# EasyEDA Pro project ProProject_电子综合板子_2025-11-11.epro

# Schematic 核心板
Create Date: 2025-10-11; Page Name: P1; Project Name: 电子综合板子; Schematic Name: 核心板; Update Date: 2025-10-14; Company: 嘉立创EDA; Page Size: A4; Version: V1.0
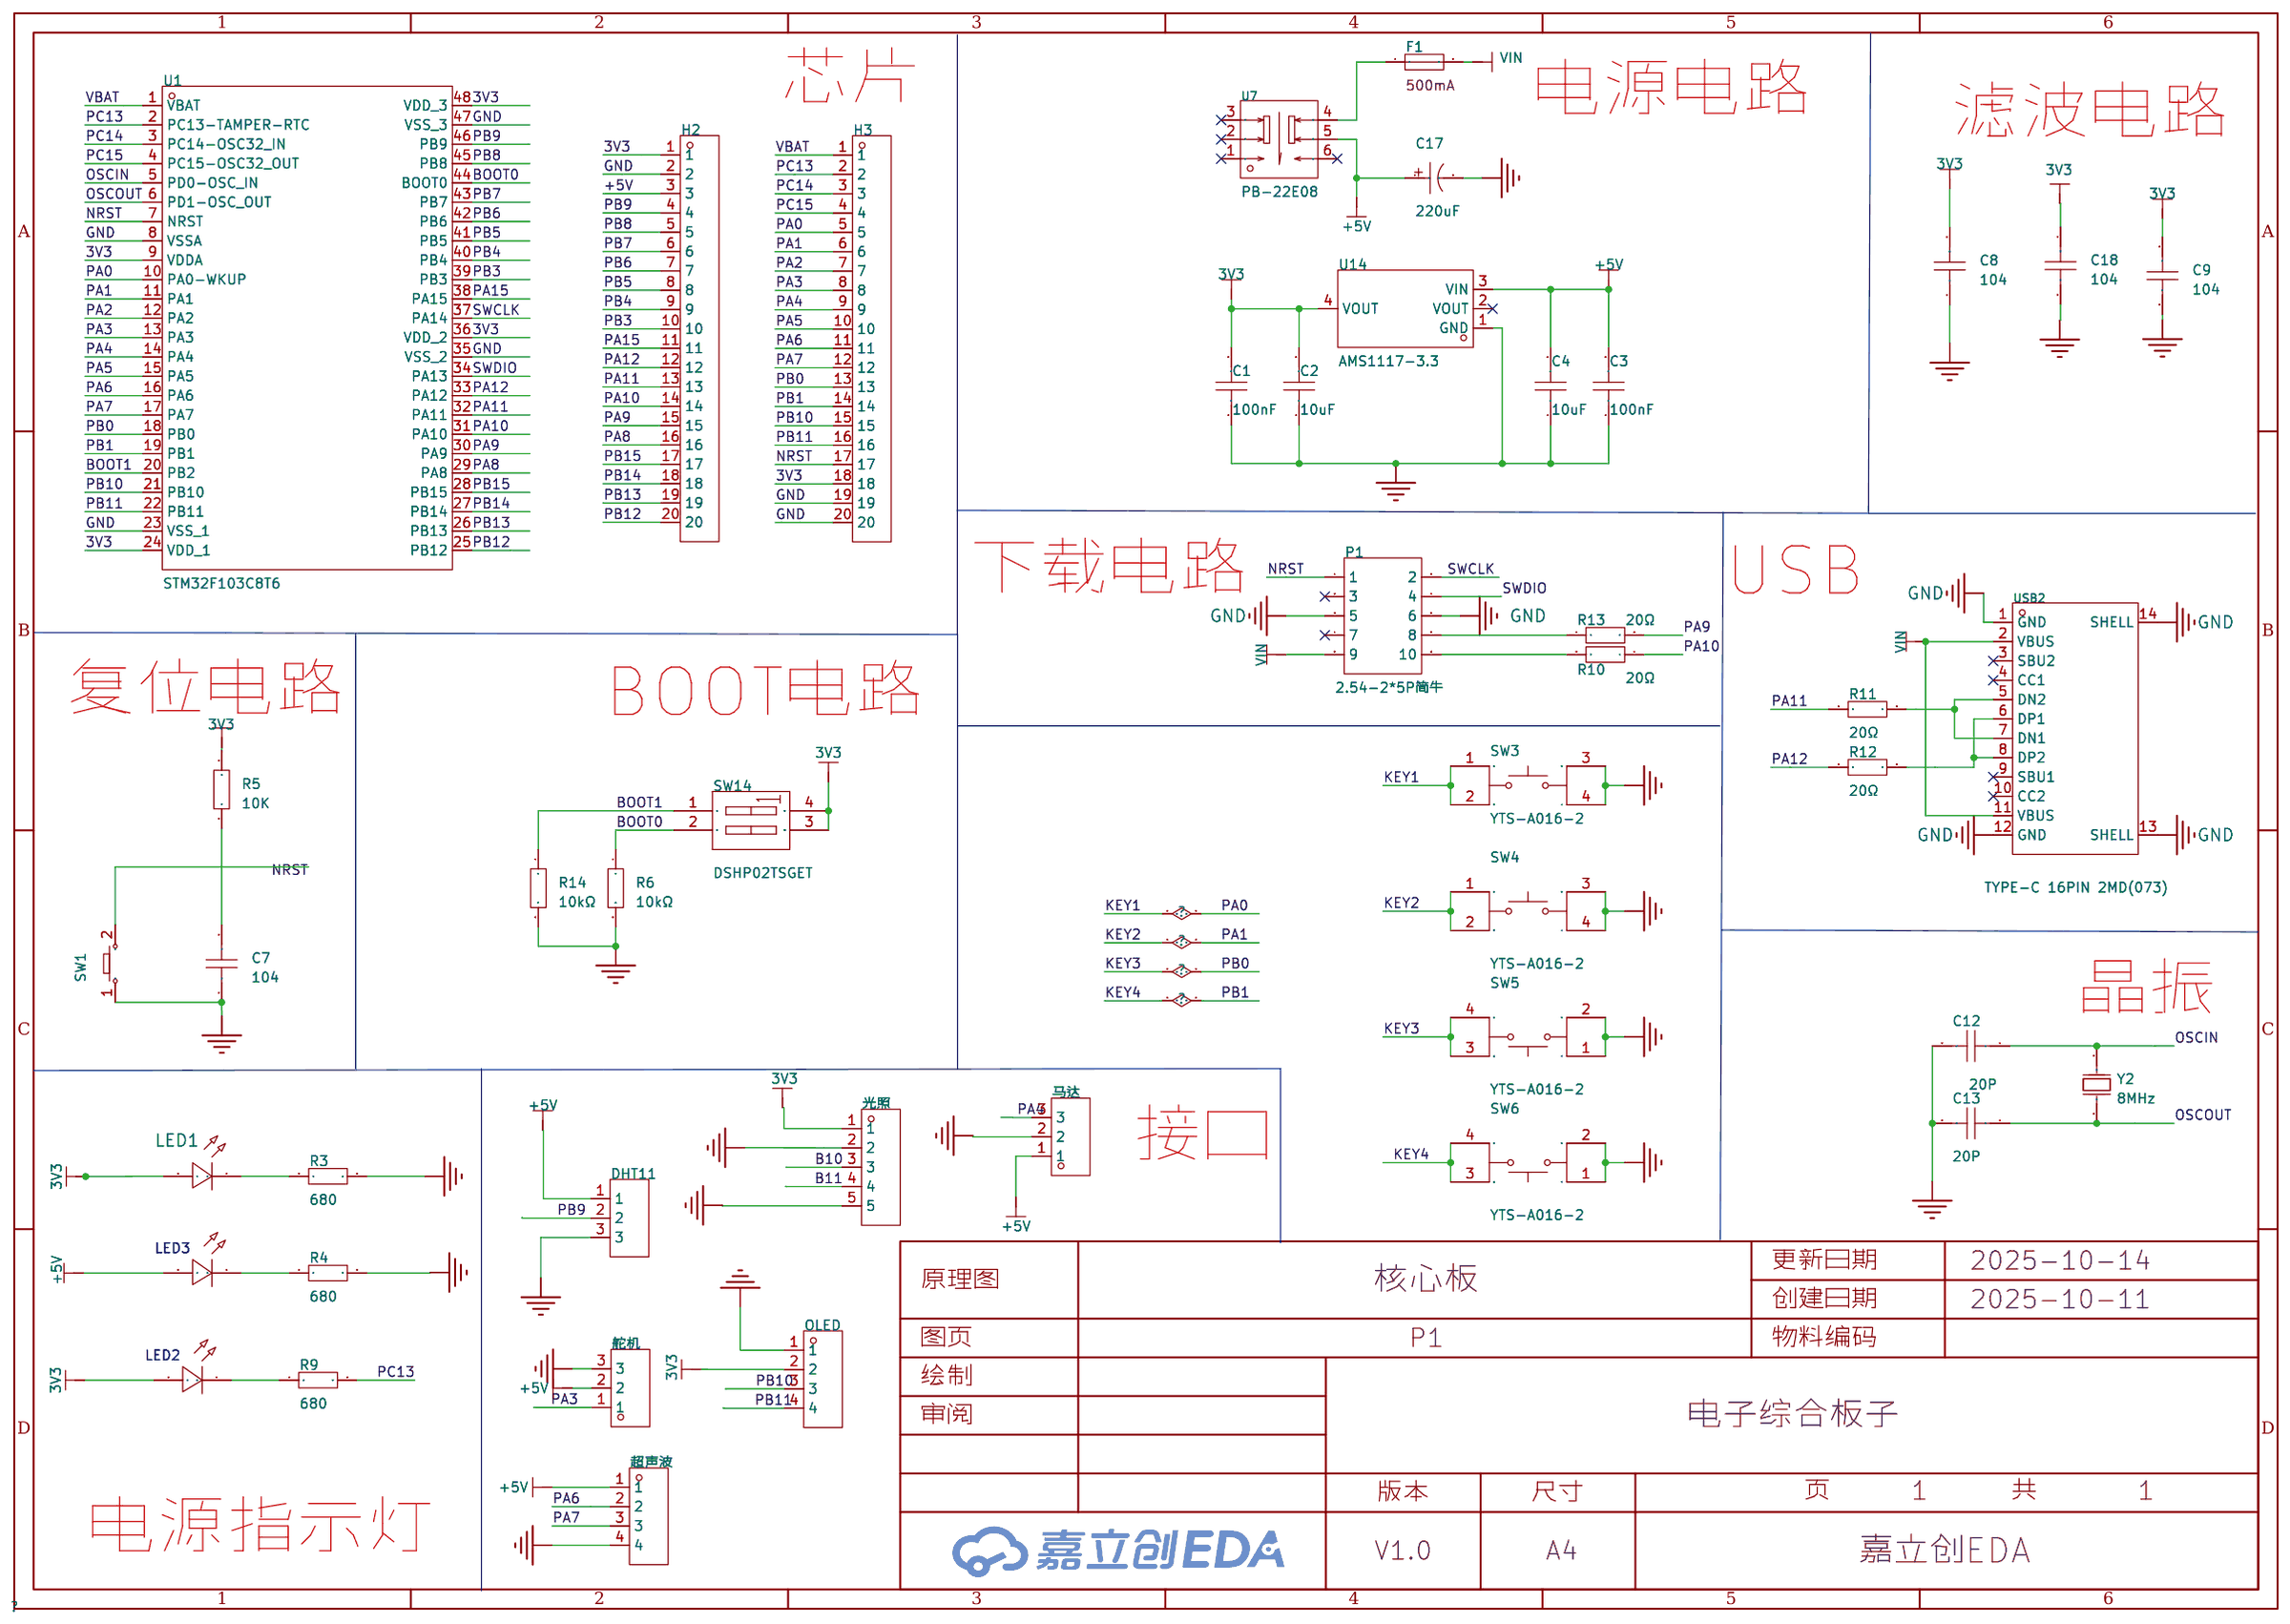
[diagram p0: schematic sheet]

## Parts
C1  100nF  [C0603]
C2  10uF  [C0603]
C3  100nF  [C0603]
C4  10uF  [C0603]
C7  104  [C0603]
C8  104  [C0603]
C9  104  [C0603]
C12  20P  [C0603]
C13  20P  [C0603]
C17  220uF  [CAP-SMD_BD6.3-L6.6-W6.6-LS7.2-R-RD]
C18  104  [C0603]
DHT11  PM254V-11-03-H85  [HDR-TH_3P-P2.54-V-F]
F1  BSMD0805-020-30V  [F0805]
H2  -  [HDR-TH_20P-P2.54-V-M-1]
H3  -  [HDR-TH_20P-P2.54-V-M-1]
LED1  -  [LED_0603]
LED2  -  [LED_0603]
LED3  -  [LED_0603]
OLED  PM254V-11-04-H85  [HDR-TH_4P-P2.54-V-F]
P1  2.54-2*5P简牛  [IDC-TH_10P-P2.54_C5665]
R3  680  [R0603]
R4  680  [R0603]
R5  10K  [R0603]
R6  10kΩ  [R0603]
R9  680  [R0603]
R10  20Ω  [R0603]
R11  20Ω  [R0603]
R12  20Ω  [R0603]
R13  20Ω  [R0603]
R14  10kΩ  [R0603]
SW1  -  [Key_SMD_3x4x2]
SW3  YTS-A016-2  [SW-SMD_4P-L4.2-W3.3-P2.15-LS4.7]
SW4  YTS-A016-2  [SW-SMD_4P-L4.2-W3.3-P2.15-LS4.7]
SW5  YTS-A016-2  [SW-SMD_4P-L4.2-W3.3-P2.15-LS4.7]
SW6  YTS-A016-2  [SW-SMD_4P-L4.2-W3.3-P2.15-LS4.7]
SW14  DSHP02TSGET  [SW-SMD_4P_DSHP02TSGET]
U1  STM32F103C8T6  [LQFP-48_L7.0-W7.0-P0.50-LS9.0-BL]
U7  PB-22E08  [SW-TH_6P-L8.0-W8.0-P2.50_PB-22E08]
U14  AMS1117-3.3  [SOT-223-3_L6.5-W3.4-P2.30-LS7.0-BR]
USB2  TYPE-C 16PIN 2MD(073)  [USB-C-SMD_TYPE-C-6PIN-2MD-073]
Y2  8MHz  [HC-49S_L11.4-W4.7-P4.88-D0.4]
光照  PM254V-11-05-H85  [HDR-TH_5P-P2.54-V-F]
舵机  -  [HDR-TH_3P-P2.54-V-M]
超声波  -  [HDR-TH_4P-P2.54-V-M]
马达  -  [HDR-TH_3P-P2.54-V-M]

## Library data of the parts
C1-C4 C7-C9 C12 C13 C18 = CAP_0603: Supplier Footprint: 0603
C17 = RVT1A221M0605: 容值:220uF;精度:±20%;额定电压:10V;纹波电流:-;等效串联电阻:-;; LCSC Part Name: 220uF ±20% 10V; Supplier Part: C3345; Manufacturer: HONOR(荣誉); Supplier Footprint: SMD,D6.3xL5.4mm; JLCPCB Part Class: 扩展库; Datasheet: https://atta.szlcsc.com/upload/public/pdf/source/20220520/1BCC52842751E84E020A4D0B70BC5F88.pdf; Supplier: LCSC; Tolerance: ±20%; Rated Voltage: 10V; φD: 6.3mm; L: 5.4mm; Lifetime @ Temp: 2000hrs@105℃; Operating Temperature: -55℃~+105℃
DHT11 = PM254V-11-03-H85: 插孔结构:1x3P;间距:2.54mm;行距:-;圆孔/方孔:方孔;安装方式:直插;排数:单排;总孔位数:3P;额定电流:3A;插孔方向:顶部;塑高:8.5mm;触头材质:黄铜;触头镀层:-;工作温度:-40℃~+105℃;; LCSC Part Name: 1x3P 间距:2.54mm 直插; Supplier Part: C541850; Manufacturer: XFCN(兴飞); Supplier Footprint: 插件,P=2.54mm; JLCPCB Part Class: 扩展库; Datasheet: https://item.szlcsc.com/datasheet/PM254V-11-03-H85/562471.html; Supplier: LCSC; Holes Structure: 1x3P; Pitch: 2.54mm; Circular Hole / Square Hole: 方孔; Mounting Type: 直插; Number of Rows: 单排; Number of Positions: 3P; Current Rating: 3A; Holes Direction: 顶部; Insulation Height: 8.5mm; Contact Material: 黄铜; Operating Temperature: -40℃~+105℃
F1 = BSMD0805-020-30V: 最大电压:30V;最大电流:40A;保持电流:200mA;跳闸电流:500mA;; LCSC Part Name: 30V 200mA 0805自恢复; Supplier Part: C883105; Manufacturer: BHFUSE(佰宏); Supplier Footprint: 0805; JLCPCB Part Class: 扩展库; Datasheet: https://atta.szlcsc.com/upload/public/pdf/source/20220223/3FD8E8A8A3681642EAEF465E16495357.pdf; Supplier: LCSC; Operating Voltage (Max): 30V; Current Rating (Max): 40A; Hold Current: 200mA; Trip Current: 500mA; Power Dissipation: 500mW; Resistance - Initial (Ri) (Min): 500mΩ; Resistance - Post Trip (R1) (Max): 3.5Ω; Maximum Time to Trip: 20ms; Operating Temperature: -40℃~+85℃
H2 H3 = HDR-M_2.54_1x20P: Supplier Part: C50981; Supplier Footprint: 插件
LED1 = LED_0603-R: Supplier Footprint: 0603
LED2 LED3 = LED_0603-B: Supplier Footprint: 0603
OLED = PM254V-11-04-H85: 插孔结构:1x4P;间距:2.54mm;行距:-;圆孔/方孔:方孔;安装方式:直插;排数:单排;总孔位数:4P;额定电流:3A;插孔方向:顶部;塑高:8.5mm;触头材质:黄铜;触头镀层:-;工作温度:-40℃~+105℃;; LCSC Part Name: 1x4P 间距:2.54mm 直插; Supplier Part: C541851; Manufacturer: XFCN(兴飞); Supplier Footprint: 插件,P=2.54mm; JLCPCB Part Class: 扩展库; Datasheet: https://item.szlcsc.com/datasheet/PM254V-11-04-H85/562472.html; Supplier: LCSC; Holes Structure: 1x4P; Pitch: 2.54mm; Circular Hole / Square Hole: 方孔; Mounting Type: 直插; Number of Rows: 单排; Number of Positions: 4P; Current Rating: 3A; Holes Direction: 顶部; Insulation Height: 8.5mm; Contact Material: 黄铜; Operating Temperature: -40℃~+105℃
P1 = 2.54-2*5P简牛: 连接器类型:简牛座;每排PIN数:5;排数:2;间距:2.54mm;行距:2.54mm;封装形式:直插;触头材质:-;触头镀层:-;; LCSC Part Name: 每排P数:5 排数:2 2.54mm; Supplier Part: C5665; Manufacturer: BOOMELE(博穆精密); Supplier Footprint: 插件,P=2.54mm; JLCPCB Part Class: 扩展库; Datasheet: https://atta.szlcsc.com/upload/public/pdf/source/20140331/1457707037896.pdf; Supplier: LCSC; Connector Type: 简牛座; Pin Number in each Row: 5; Number of Rows: 2; Pitch: 2.54mm; Row Spacing: 2.54mm; Holder Type: 直插
R3-R5 R9 = Res_0603: Supplier Footprint: 0603
R6 R14 = RC0603JR-0710KL: 电阻类型:厚膜电阻;阻值:10kΩ;精度:±5%;功率:100mW;; LCSC Part Name: 10kΩ ±5% 100mW; Supplier Part: C99198; Manufacturer: YAGEO(国巨); Supplier Footprint: 0603; JLCPCB Part Class: 扩展库; Datasheet: https://atta.szlcsc.com/upload/public/pdf/source/20181223/C99198_917934A193F41F77D9F7D214A8C79116.pdf; Supplier: LCSC; Type: 厚膜电阻; Tolerance: ±5%; Power(Watts): 100mW; Temperature Coefficient: ±100ppm/℃; Overload Voltage (Max): 75V; Operating Temperature Range: -55℃~+155℃
R10-R13 = 0603WAF200JT5E: 电阻类型:厚膜电阻;阻值:20Ω;精度:±1%;功率:100mW;; LCSC Part Name: 20Ω ±1% 100mW; Supplier Part: C22950; Manufacturer: UNI-ROYAL(厚声); Supplier Footprint: 0603; JLCPCB Part Class: Basic Part; Datasheet: https://atta.szlcsc.com/upload/public/pdf/source/20200306/C422600_1E6D84923E4A46A82E41ADD87F860B5C.pdf; Supplier: LCSC; Type: 厚膜电阻; Tolerance: ±1%; Power(Watts): 100mW; Temperature Coefficient: ±100ppm/℃; Overload Voltage (Max): 75V; Operating Temperature Range: -55℃~+155℃
SW1 = Key_SMD_3x4x2: Supplier Footprint: SMD
SW3-SW6 = YTS-A016-2: 电路结构:单刀单掷;按钮形状:椭圆形按钮;作用力:2.6N;安装方式:立贴;开关长度:4.2mm;开关宽度:3.4mm;开关高度:2.5mm;带支架:不带;触点电流:50mA;额定电压(DC):12V;绝缘电阻:100MΩ;机械寿命:10万次;; LCSC Part Name: 4.2*3.4*2.5mm 立贴 轻触开关; Supplier Part: C2910673; Manufacturer: YIYUAN(怡远); Supplier Footprint: SMD; JLCPCB Part Class: 扩展库; Datasheet: https://atta.szlcsc.com/upload/public/pdf/source/20211104/F07B7201482F381EAEC9C23BE16B5334.pdf; Supplier: LCSC; Circuit: 单刀单掷; Actuator Style: 椭圆形按钮; Operating Force: 2.6N; Mounting Style: 立贴; Switch Length: 4.2mm; Switch Width: 3.4mm; Switch Height: 2.5mm; Strike Gundam: 不带; Contact Current: 50mA; Voltage Rating (DC): 12V; Insulation Resistance: 100MΩ; Actuator/Cap Color: 白色; Pin Style: J型引脚; Mechanical Life: 10万次
SW14 = DSHP02TSGET: 类型:平拨，凹槽式;电路结构:单刀单掷;开关位数:2;引脚间距:1.27mm;颜色:黑色;; LCSC Part Name: 2位 1.27间距; Supplier Part: C40735; Manufacturer: YE; Supplier Footprint: SMD-4P,4.1x5.4mm; JLCPCB Part Class: 扩展库; Datasheet: https://atta.szlcsc.com/upload/public/pdf/source/20150928/1457707425261.pdf; Supplier: LCSC; Type: 平拨，凹槽式; Circuit: 单刀单掷; Number of Positions: 2; Lead Pitch: 1.27mm; Color: 黑色
U1 = STM32F103C8T6: LCSC Part Name: 主流增强型ARM Cortex-M3 MCU，具有64 KB Flash、72 MHz CPU、电机控制、USB和CAN; Supplier Part: C8734; Manufacturer: ST(意法半导体); Supplier Footprint: LQFP-48(7x7); JLCPCB Part Class: 扩展库; Datasheet: https://atta.szlcsc.com/upload/public/pdf/source/20220812/8363ACEC51AD55ECEB84799464F7CB85.pdf; Supplier: LCSC; CPU Core: ARM-M3; Program Storage Size: 64KB; RAM Size: 20KB; GPIO Ports Number: 37; Operating Voltage Range: 2V~3.6V; CPU Maximum Speed: 72MHz; Program Memory Type: FLASH; Operating Temperature Range: -40℃~+85℃; ADC (Bit): 12bit; Universal Serial Bus: 有; Peripheral/Function: 看门狗；DMA；看门狗；温度传感器; Watchdog: 有; Infrared Data Association: 有; Low-Voltage Detect: 有; Direct Memory Access: 有; Internal Oscillator: 有
U7 = PB-22E08: LCSC Part Name: 自锁按键开关; Supplier Part: C2848958; Manufacturer: G-Switch(品赞); Supplier Footprint: 8x8mm; Datasheet: https://atta.szlcsc.com/upload/public/pdf/source/20230616/E4440AC7CE198A071B7CAB3CD31ABBEA.pdf; Supplier: LCSC
U14 = AMS1117-3.3_C6186: 输出类型:固定;最大输入电压:-;输出电压:3.3V;最大输出电流:1A;电源纹波抑制比(PSRR):72dB@(120Hz);输出极性:正极;; LCSC Part Name: 输出3.3V 1A; Supplier Part: C6186; Manufacturer: AMS; Supplier Footprint: SOT-223-3; JLCPCB Part Class: 基础库; Datasheet: https://atta.szlcsc.com/upload/public/pdf/source/20180727/C6186_7A095716F0823C02F1997A905E26C086.pdf; Supplier: LCSC; Output Type: 固定; Output Voltage: 3.3V; MAX Output Current: 1A; Power Supply Rejection Ratio (PSRR): 72dB@(120Hz); Dropout Voltage: 1.3V@(800mA); Output Polarity: 正极; Number of Outputs: 1
USB2 = TYPE-C 16PIN 2MD(073): 连接器类型:Type-C;标准:-;公母:母座;触点数量:16;端口数量:1;安装方式:卧贴;额定电流 - 电源:5A;工作温度范围:-25℃~+85℃;; LCSC Part Name: TYPE-C母座 16P 4脚插件带定位柱 不锈钢外壳 2次模顶; Supplier Part: C2765186; Manufacturer: SHOU HAN(首韩); Supplier Footprint: SMD; JLCPCB Part Class: 扩展库; Datasheet: https://item.szlcsc.com/datasheet/TYPE-C%252016PIN%25202MD(073)/2901843.html; Supplier: LCSC; Connector Type: Type-C; Gender: 母座; Mounting Type: 卧贴; Number of Contacts: 16; Number of Ports: 1; Current Rating-Power: 3A; Voltage Rating: 5V; Connect-Disconnect Life: 5千次; Detection color: 黑色; Operating Temperature: -25℃~+85℃; Mounting Style: 卧贴; Current Rating - Power (Max): 5A; Operating Temperature Range: -25℃~+85℃
Y2 = ECS-080-20-4X-DU: LCSC Part Name: 8MHz ±30ppm 20pF; Supplier Part: C2636160; Manufacturer: ECS; Supplier Footprint: HC-49S; JLCPCB Part Class: 扩展库; Datasheet: https://atta.szlcsc.com/upload/public/pdf/source/20181031/C312311_8C746D9B0903A43D812CE762944D4B2E.pdf; Supplier: LCSC; Normal temperature Frequency Tolerance: ±30ppm; External load capacitor: 20pF; Frequency Stability(Full temperature range): ±100ppm; Equivalent Series Resistance (ESR): 80Ω; Operating Temperature: -55℃~+125℃
光照 = PM254V-11-05-H85: 插孔结构:1x5P;间距:2.54mm;行距:-;圆孔/方孔:方孔;安装方式:直插;排数:单排;总孔位数:5P;额定电流:3A;插孔方向:顶部;塑高:8.5mm;触头材质:黄铜;触头镀层:-;工作温度:-40℃~+105℃;; LCSC Part Name: 1x5P 间距:2.54mm 直插; Supplier Part: C541852; Manufacturer: XFCN(兴飞); Supplier Footprint: 插件,P=2.54mm; JLCPCB Part Class: 扩展库; Datasheet: https://item.szlcsc.com/datasheet/PM254V-11-05-H85/562473.html; Supplier: LCSC; Holes Structure: 1x5P; Pitch: 2.54mm; Circular Hole / Square Hole: 方孔; Mounting Type: 直插; Number of Rows: 单排; Number of Positions: 5P; Current Rating: 3A; Holes Direction: 顶部; Insulation Height: 8.5mm; Contact Material: 黄铜; Operating Temperature: -40℃~+105℃
舵机 马达 = HDR-M_2.54_1x3P: Supplier Part: C2937625; Supplier Footprint: 插件
超声波 = HDR-M_2.54_1x4P: Supplier Part: C492403; Supplier Footprint: 插件

## Nets
3V3: C1.2 C2.2 C18.1 H2.1 H3.18 LED2.2(A) OLED.2 SW14.3(B2) SW14.4(B1) U1.9(VDDA) U1.24(VDD_1) U14.4(VOUT)
+5V: C3.2 C4.2 H2.3 U14.3(VIN) 舵机.2
GND: C1.1 C2.1 C3.1 C4.1 C7.1 C18.2 H2.2 H3.19 H3.20 OLED.1 R6.2 R14.2 SW3.3 SW3.4 SW4.3 SW4.4 SW5.1 SW5.2 SW6.1 SW6.2 U1.8(VSSA) U1.23(VSS_1) U14.1(GND) USB2.1(GND) USB2.12(GND) USB2.13(SHELL) USB2.14(SHELL) 舵机.3
VBAT: H3.1 U1.1(VBAT)
VIN: USB2.2(VBUS) USB2.11(VBUS)
BOOT0: R6.1 SW14.2(A2)
BOOT1: R14.1 SW14.1(A1) U1.20(PB2)
KEY1: H3.5 SW3.1 SW3.2 U1.10(PA0-WKUP)
KEY2: H3.6 SW4.1 SW4.2 U1.11(PA1)
KEY3: H3.13 SW5.3 SW5.4 U1.18(PB0)
KEY4: H3.14 SW6.3 SW6.4 U1.19(PB1)
NRST: H3.17 U1.7(NRST)
OSCIN: U1.5(PD0-OSC_IN) Y2.2
OSCOUT: U1.6(PD1-OSC_OUT) Y2.1
PA2: H3.7 U1.12(PA2)
PA3: H3.8 U1.13(PA3) 舵机.1
PA4: H3.9 U1.14(PA4)
PA5: H3.10 U1.15(PA5)
PA6: H3.11 U1.16(PA6)
PA7: H3.12 U1.17(PA7)
PA8: H2.16
PA9: H2.15
PA10: H2.14
PA11: H2.13 R11.1
PA12: H2.12 R12.1
PA15: H2.11
PB3: H2.10
PB4: H2.9
PB5: H2.8
PB6: H2.7
PB7: H2.6
PB8: H2.5
PB9: H2.4
PB10: H3.15 OLED.3 U1.21(PB10)
PB11: H3.16 OLED.4 U1.22(PB11)
PB12: H2.20
PB13: H2.19
PB14: H2.18
PB15: H2.17
PC13: H3.2 R9.2 U1.2(PC13-TAMPER-RTC)
PC14: H3.3 U1.3(PC14-OSC32_IN)
PC15: H3.4 U1.4(PC15-OSC32_OUT)
$1N1999: LED2.1(C) R9.1
Net-(USB2-5): USB2.5(DN2) USB2.7(DN1)
Net-(USB2-6): USB2.6(DP1) USB2.8(DP2)

Not connected (* = marked no-connect by the designer): C7 2; C8 1 2; C9 1 2; C12 1 2; C13 1 2; C17 1 2; DHT11 1 2 3; F1 1 2; LED1 1(C) 2(A); LED3 1(C) 2(A); P1 1 2 3* 4 5 6 7* 8 9 10; R3 1 2; R4 1 2; R5 1 2; R10 1 2; R11 2; R12 2; R13 1 2; SW1 1 2; U1 25(PB12) 26(PB13) 27(PB14) 28(PB15) 29(PA8) 30(PA9) 31(PA10) 32(PA11) 33(PA12) 34(PA13) 35(VSS_2) 36(VDD_2) 37(PA14) 38(PA15) 39(PB3) 40(PB4) 41(PB5) 42(PB6) 43(PB7) 44(BOOT0) 45(PB8) 46(PB9) 47(VSS_3) 48(VDD_3); U7 1* 2* 3* 4 5 6*; U14 2(VOUT)*; USB2 3(SBU2)* 4(CC1)* 9(SBU1)* 10(CC2)*; 光照 1 2 3 4 5; 超声波 1 2 3 4; 马达 1 2 3

## Notes on the sheet
- 芯片
- 电源电路
- 滤波电路
- 下载电路
- USB
- 复位电路
- BOOT电路
- 晶振
- 接口
- 电源指示灯

# Board PCB1
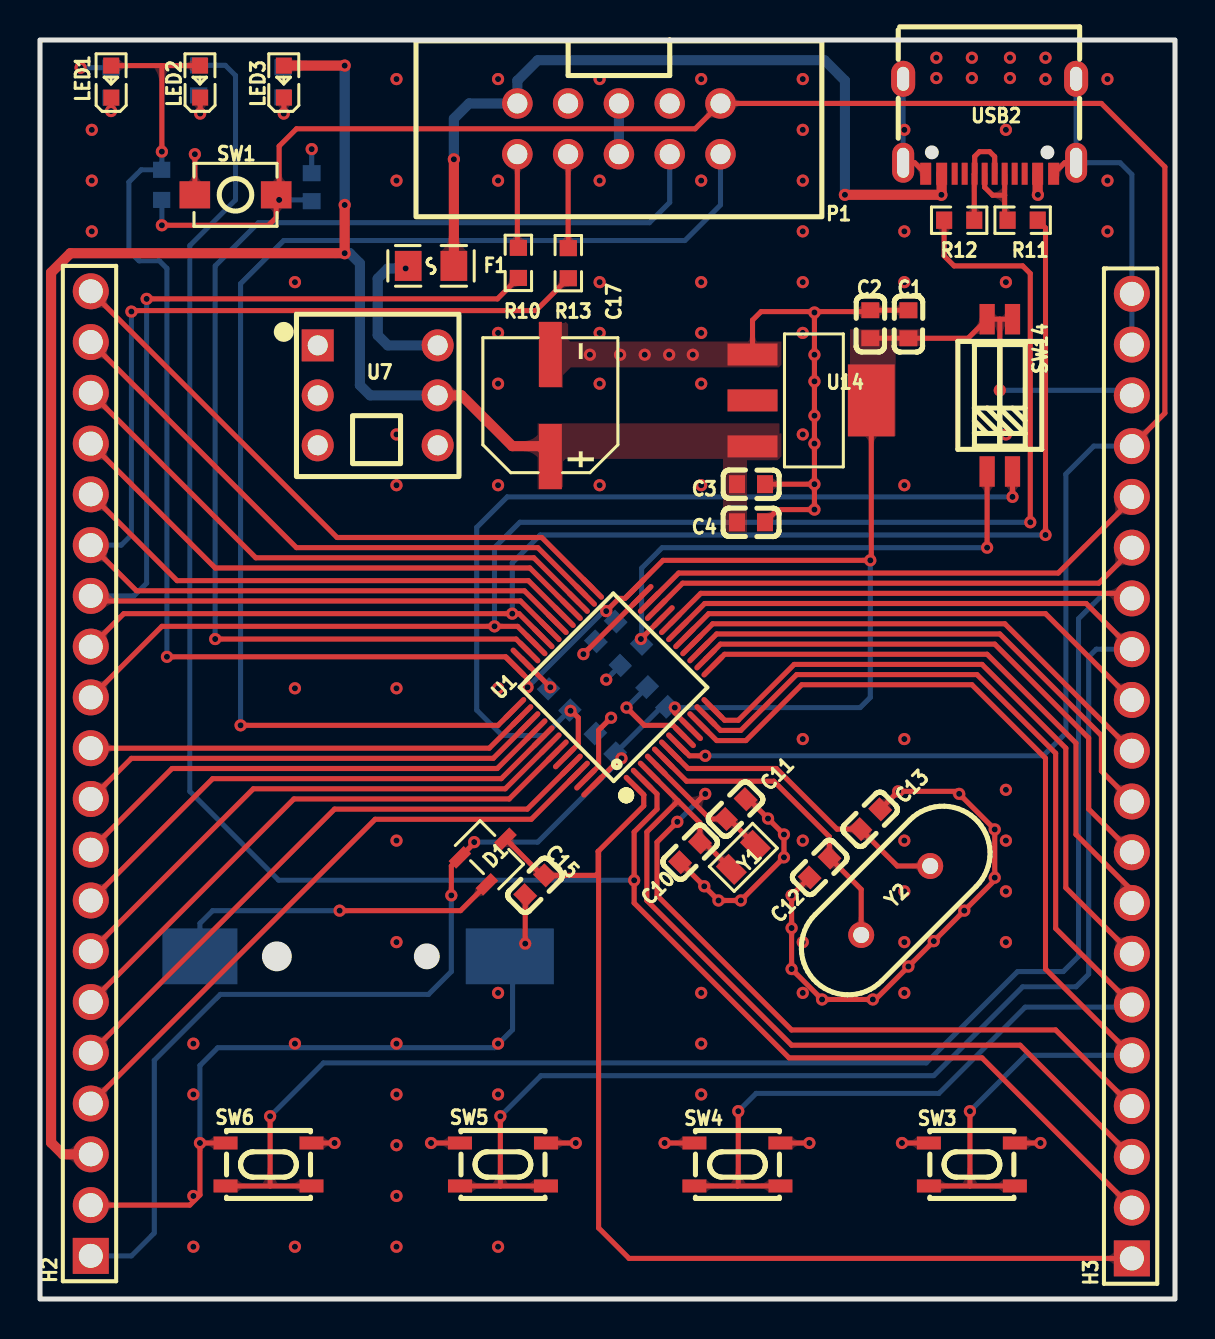
[diagram p1: board, top side]
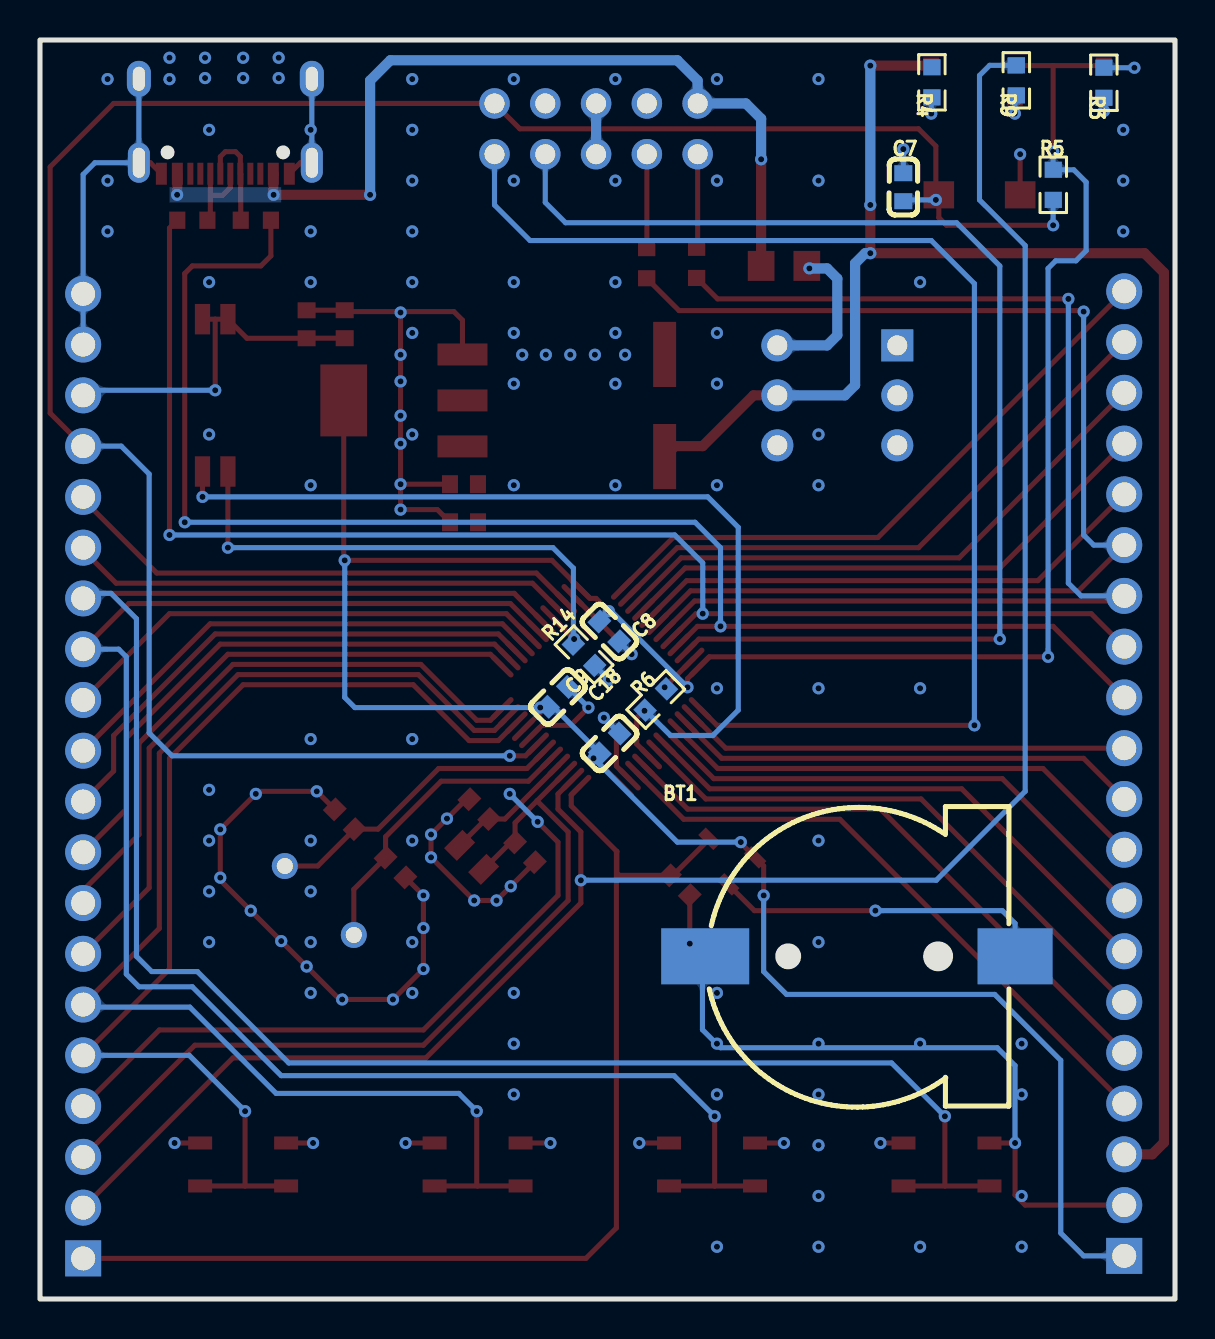
[diagram p2: board, bottom side, seen from below]

Outline 56.77 x 62.99 mm; copper layers: Top Layer, Inner1, Inner2, Inner3, Inner4, Inner5, Inner6, Inner7, Inner8, Inner9, Inner10, Inner11, Inner12, Inner13, Inner14, Inner15, Inner16, Inner17, Inner18, Inner19, Inner20, Inner21, Inner22, Inner23, Inner24, Inner25, Inner26, Inner27, Inner28, Inner29, Inner30, Bottom Layer. Coordinates in mm from the lower left corner of the outline.
Outline path: rectangle 0,62.99 56.77,0
Stack: Top Layer 0.035mm / Dielectric1 1.51mm FR4 er 4.5 / Bottom Layer 0.035mm

## Design rules (mm)
template: JLCPCB Capability(Two Layers Board)
spacing copperThickness1oz (default): track to track 0.102, other pairs 0.152 to 0.3
spacing copperThickness2oz: track to track 0.203, other pairs 0.152 to 0.3
track width copperThickness1oz (default): min 0.127, default 0.254, max 2.54
track width copperThickness2oz: min 0.203, default 0.254, max 2.54
differential pair differentialPair (default): width min 0.127, default 0.254, max 2.54; gap min 0.152, default 0.152
via viaSize (default): diameter min 0.5, default 0.61, max 10; hole min 0.3, default 0.305, max 6.3

## Placement (name value [footprint] x y rotation side)
BT1  BS-12-B3AA003  [BAT-SMD_BS-12-B3AA011]  15.75 17.14 180 bottom
C1  100nF  [C0603]  43.43 48.77 270 top
C2  10uF  [C0603]  41.53 48.77 270 top
C3  100nF  [C0603]  35.56 40.77 180 top
C4  10uF  [C0603]  35.56 38.86 180 top
C7  104  [C0603]  13.59 55.63 270 bottom
C8  104  [C0603]  28.3 33.4 45 bottom
C9  104  [C0603]  30.86 30.12 135 bottom
C10  20P  [C0603]  32.51 22.35 225 top
C11  20P  [C0603]  34.8 24.51 45 top
C12  20P  [C0603]  38.99 21.59 225 top
C13  20P  [C0603]  41.53 24 45 top
C15  100nF  [C0603]  24.77 20.7 45 top
C17  220uF  [CAP-SMD_BD6.3-L6.6-W6.6-LS7.2-R-RD]  25.53 44.7 270 top
C18  104  [C0603]  28.27 27.8 135 bottom
D1  BAT54C  [SOT-23-3_L2.9-W1.4-P1.91-LS2.6-BR]  22.48 22.22 225 top
F1  BSMD0805-020-30V  [F0805]  19.56 51.69 0 top
H2  -  [HDR-TH_20P-P2.54-V-M-1]  2.54 26.29 90 top
H3  -  [HDR-TH_20P-P2.54-V-M-1]  54.61 26.16 90 top
LED1  -  [LED_0603]  3.56 60.96 90 top
LED2  -  [LED_0603]  8 60.96 90 top
LED3  -  [LED_0603]  12.19 60.96 90 top
P1  2.54-2*5P简牛  [IDC-TH_10P-P2.54_C5665]  28.96 58.55 180 top
R3  680  [R0603]  3.56 60.85 90 bottom
R4  680  [R0603]  12.16 60.87 90 bottom
R5  10K  [R0603]  6.09 55.74 90 bottom
R6  10kΩ  [R0603]  25.97 30 135 bottom
R9  680  [R0603]  7.94 60.97 90 bottom
R10  20Ω  [R0603]  23.93 51.84 90 top
R11  20Ω  [R0603]  49.15 53.97 180 top
R12  20Ω  [R0603]  45.97 53.97 0 top
R13  20Ω  [R0603]  26.42 51.82 270 top
R14  10kΩ  [R0603]  29.56 32.23 225 bottom
SW1  -  [Key_SMD_3x4x2]  9.78 55.25 0 top
SW3  YTS-A016-2  [SW-SMD_4P-L4.2-W3.3-P2.15-LS4.7]  46.61 6.73 180 top
SW4  YTS-A016-2  [SW-SMD_4P-L4.2-W3.3-P2.15-LS4.7]  34.88 6.73 180 top
SW5  YTS-A016-2  [SW-SMD_4P-L4.2-W3.3-P2.15-LS4.7]  23.16 6.73 0 top
SW6  YTS-A016-2  [SW-SMD_4P-L4.2-W3.3-P2.15-LS4.7]  11.43 6.73 0 top
SW14  DSHP02TSGET  [SW-SMD_4P_DSHP02TSGET]  48.01 45.21 0 top
U1  STM32F103C8T6  [LQFP-48_L7.0-W7.0-P0.50-LS9.0-BL]  28.7 30.61 45 top
U7  PB-22E08  [SW-TH_6P-L8.0-W8.0-P2.50_PB-22E08]  16.89 45.21 270 top
U14  AMS1117-3.3  [SOT-223-3_L6.5-W3.4-P2.30-LS7.0-BR]  38.61 44.96 180 top
USB2  TYPE-C 16PIN 2MD(073)  [USB-C-SMD_TYPE-C-6PIN-2MD-073]  47.5 58.67 180 top
Y1  32.768K  [OSC-SMD_L2.0-W1.2]  35.18 22.1 225 top
Y2  8MHz  [HC-49S_L11.4-W4.7-P4.88-D0.4]  42.8 19.94 225 top

## Footprints (pads in the part's own frame, mm; a bottom-side part is the same pattern mirrored in y, then rotated)
BAT-SMD_BS-12-B3AA011
  rect 3.75x2.8 smd: 1(7.75,0)
  rect 4.4x2.8 smd: 2(-7.75,0)
C0603
  rect 0.8x0.9 smd: 1(-0.7,0) 2(0.7,0)
CAP-SMD_BD6.3-L6.6-W6.6-LS7.2-R-RD
  rect 3.26x1.15 smd: 1(2.555,0) 2(-2.555,0)
F0805
  rect 1.335x1.5 smd: 1(-1.143,0) 2(1.143,0)
HC-49S_L11.4-W4.7-P4.88-D0.4
  round 1.3 hole 0.8: 1(-2.44,0) 2(2.44,0)
HDR-TH_20P-P2.54-V-M-1
  rect 1.8x1.8 hole 1.2: 1(-24.13,0)
  round 1.8 hole 1.2: 2(-21.59,0) 3(-19.05,0) 4(-16.51,0) 5(-13.97,0) 6(-11.43,0) 7(-8.89,0) 8(-6.35,0) 9(-3.81,0) 10(-1.27,0) 11(1.27,0) 12(3.81,0) 13(6.35,0) 14(8.89,0) 15(11.43,0) 16(13.97,0) 17(16.51,0) 18(19.05,0) 19(21.59,0) 20(24.13,0)
IDC-TH_10P-P2.54_C5665
  round 1.524 hole 1: 1(-5.08,-1.27) 2(-5.08,1.27) 3(-2.54,-1.27) 4(-2.54,1.27) 5(0,-1.27) 6(0,1.27) 7(2.54,-1.27) 8(2.54,1.27) 9(5.08,-1.27) 10(5.08,1.27)
Key_SMD_3x4x2
  rect 1.53x1.36 smd: 1(-2.035,0) 2(2.035,0)
LED_0603
  rect 0.8x0.8 smd: 1(-0.851,-0.01) 2(0.75,-0.005)
LQFP-48_L7.0-W7.0-P0.50-LS9.0-BL
  oval 0.27x1.5 smd: 1(-2.75,-4.25) 2(-2.25,-4.25) 3(-1.75,-4.25) 4(-1.25,-4.25) 5(-0.75,-4.25) 6(-0.25,-4.25) 7(0.25,-4.25) 8(0.75,-4.25) 9(1.25,-4.25) 10(1.75,-4.25) 11(2.25,-4.25) 12(2.75,-4.25) 25(2.75,4.25) 26(2.25,4.25) 27(1.75,4.25) 28(1.25,4.25) 29(0.75,4.25) 30(0.25,4.25) 31(-0.25,4.25) 32(-0.75,4.25) 33(-1.25,4.25) 34(-1.75,4.25) 35(-2.25,4.25) 36(-2.75,4.25)
  oval 1.5x0.27 smd: 13(4.25,-2.75) 14(4.25,-2.25) 15(4.25,-1.75) 16(4.25,-1.25) 17(4.25,-0.75) 18(4.25,-0.25) 19(4.25,0.25) 20(4.25,0.75) 21(4.25,1.25) 22(4.25,1.75) 23(4.25,2.25) 24(4.25,2.75) 37(-4.25,2.75) 38(-4.25,2.25) 39(-4.25,1.75) 40(-4.25,1.25) 41(-4.25,0.75) 42(-4.25,0.25) 43(-4.25,-0.25) 44(-4.25,-0.75) 45(-4.25,-1.25) 46(-4.25,-1.75) 47(-4.25,-2.25) 48(-4.25,-2.75)
OSC-SMD_L2.0-W1.2
  rect 0.9x1.3 smd: 1(-0.85,0) 2(0.85,0)
R0603
  rect 0.806x0.864 smd: 1(-0.753,0) 2(0.753,0)
SOT-23-3_L2.9-W1.4-P1.91-LS2.6-BR
  rect 1.07x0.532 smd: 1(1.135,-0.955) 2(1.135,0.955) 3(-1.135,0)
SOT-223-3_L6.5-W3.4-P2.30-LS7.0-BR
  rect 2.5x1.1 smd: 1(2.97,-2.3) 2(2.97,0) 3(2.97,2.3)
  rect 2.34x3.6 smd: 4(-2.97,0)
SW-SMD_4P-L4.2-W3.3-P2.15-LS4.7
  rect 1.2x0.65 smd: 1(-2.15,1.075) 2(2.15,1.075) 3(-2.15,-1.075) 4(2.15,-1.075)
SW-SMD_4P_DSHP02TSGET
  rect 0.762x1.524 smd: 1(-0.635,-3.81) 2(0.635,-3.81) 3(0.635,3.81) 4(-0.635,3.81)
SW-TH_6P-L8.0-W8.0-P2.50_PB-22E08
  rect 1.6x1.6 hole 1: 1(-2.5,-3)
  round 1.6 hole 1: 2(0,-3) 3(2.5,-3) 4(-2.5,3) 5(0,3) 6(2.5,3)
USB-C-SMD_TYPE-C-6PIN-2MD-073
  rect 0.55x1.1 smd: 1(-3.2,2.375) 2(-2.4,2.375) 11(2.4,2.375) 12(3.2,2.375)
  rect 0.3x1.1 smd: 3(-1.75,2.375) 4(-1.25,2.375) 5(-0.75,2.375) 6(-0.25,2.375) 7(0.25,2.375) 8(0.75,2.375) 9(1.25,2.375) 10(1.75,2.375)
  oval 1.1x2 hole 0.6x1.5: 13(-4.325,1.825) 14(4.325,1.825)
  oval 1.2x1.8 hole 0.6x1.2: 13(-4.325,-2.375) 14(4.325,-2.375)

## Nets
3V3: C1.2 C2.2 C8.2 C9.1 C18.1 D1.1 H2.1 H3.18 LED1.2 LED2.2 R5.2 SW14.3 SW14.4 U1.9 U1.24 U1.36 U1.48 U14.4
+5V: C3.2 C4.2 C17.1 H2.3 LED3.2 U7.5 U14.3
GND: BT1.2 C1.1 C2.1 C3.1 C4.1 C7.1 C8.1 C9.2 C10.2 C11.2 C12.2 C13.2 C15.1 C17.2 C18.2 H2.2 H3.19 H3.20 P1.5 P1.6 R3.2 R4.2 R6.2 R14.2 SW1.1 SW3.3 SW3.4 SW4.3 SW4.4 SW5.1 SW5.2 SW6.1 SW6.2 U1.8 U1.23 U1.35 U1.47 U14.1 USB2.1 USB2.12 USB2.13 USB2.14
VBAT: C15.2 D1.3 H3.1 U1.1
VIN: F1.2 P1.9 USB2.2 USB2.11
BOOT0: R6.1 SW14.2 U1.44
BOOT1: R14.1 SW14.1 U1.20
KEY1: H3.5 SW3.1 SW3.2 U1.10
KEY2: H3.6 SW4.1 SW4.2 U1.11
KEY3: H3.13 SW5.3 SW5.4 U1.18
KEY4: H3.14 SW6.3 SW6.4 U1.19
NRST: C7.2 H3.17 P1.1 R5.1 SW1.2 U1.7
OSCIN: C12.1 U1.5 Y2.2
OSCOUT: C13.1 U1.6 Y2.1
PA2: H3.7 U1.12
PA3: H3.8 U1.13
PA4: H3.9 U1.14
PA5: H3.10 U1.15
PA6: H3.11 U1.16
PA7: H3.12 U1.17
PA8: H2.16 U1.29
PA9: H2.15 R13.2 U1.30
PA10: H2.14 R10.1 U1.31
PA11: H2.13 R11.1 U1.32
PA12: H2.12 R12.1 U1.33
PA15: H2.11 U1.38
PB3: H2.10 U1.39
PB4: H2.9 U1.40
PB5: H2.8 U1.41
PB6: H2.7 U1.42
PB7: H2.6 U1.43
PB8: H2.5 U1.45
PB9: H2.4 U1.46
PB10: H3.15 U1.21
PB11: H3.16 U1.22
PB12: H2.20 U1.25
PB13: H2.19 U1.26
PB14: H2.18 U1.27
PB15: H2.17 U1.28
PC13: H3.2 R9.2 U1.2
PC14: C10.1 H3.3 U1.3 Y1.2
PC15: C11.1 H3.4 U1.4 Y1.1
SWCLK: P1.2 U1.37
SWDIO: P1.4 U1.34
$1N1572: LED1.1 R3.1
$1N1573: LED3.1 R4.1
$1N1999: LED2.1 R9.1
$1N2194: BT1.1 D1.2
$1N2577: R11.2 USB2.5 USB2.7
$1N2578: R12.2 USB2.6 USB2.8
$1N2967: F1.1 U7.4
$1N3147: P1.8 R13.1
$1N3155: P1.10 R10.2

Pads without a net: P1 3 7; U7 1 2 3 6; U14 2; USB2 3 4 9 10

## Via types
v1: diameter 0.61, hole 0.305, Top Layer to Bottom Layer, 177 vias

## Routing (per net, layer and track width the routed paths; a pad name or vN(x,y) marks a point on that pad's centre or on a via; arc(x,y) is an arc through that point)
3V3: length 171.8
  Top Layer w0.254: v1(31.75,29.59) 31.75,29.33 U1.9 ; 48.01,45.47 48.01,49.02 ; 48.01,49.02 SW14.4 46.42,48.07 C1.2 43.43,48.07 C2.2 ; 48.01,49.02 SW14.3 ; U1.48 29.03,27.05 v1(29.08,27.05) ; 6.09,61.71 6.1,61.7 v1(6.1,57.4) ; 6.09,61.71 8.01,61.71 ; 6.09,61.71 LED1.2 ; v1(6.35,32.13) 23.29,32.13 U1.36 24.38,31.04 v1(24.38,30.61) ; U14.4 41.58,36.96 31.16,36.96 U1.24 29.26,35.05 28.96,35.05 v1(28.32,34.42) ; v1(21.72,22.86) 21.72,22.81 D1.1 20.57,21.67 v1(20.57,20.19)
  Bottom Layer w0.254: v1(24.38,30.61) 28.19,34.42 v1(28.32,34.42) 28.32,34.36 28.79,33.9 ; v1(21.72,22.86) 24.89,22.86 v1(29.08,27.05) 28.83,27.31 28.77,27.31 31.09,29.63 C9.1 31.39,29.59 v1(31.75,29.59) 41.02,29.59 41.53,30.1 v1(41.53,36.96) ; 47.88,45.47 54.36,45.47 H3.18 ; H2.1 4.57,2.16 5.71,3.3 5.71,11.94 9.02,15.24 19.43,15.24 20.57,16.38 v1(20.57,20.19) ; v1(6.1,57.4) 6.1,56.51 R5.2 5.06,56.5 4.44,55.88 4.44,52.45 4.95,51.94 5.97,51.94 6.35,51.56 v1(6.35,32.13)
  vias: v1(48.01,45.47)
+5V: length 91.3
  Top Layer w0.508: H2.3 1.14,7.24 0.55,7.83 0.55,51.35 1.52,52.32 v1(15.24,52.32) v1(15.24,54.74) ; LED3.2 v1(15.24,61.71) ; U7.5 21.08,45.21 23.62,42.67 25,42.67 C17.1
  Bottom Layer w0.508: v1(15.24,61.71) v1(15.24,54.74) ; U7.5 16.51,45.21 16,45.72 16,51.82 15.49,52.32 v1(15.24,52.32)
GND: length 157.5
  Top Layer w0.254: C13.2 v1(42.93,25.4) 45.85,25.4 v1(45.97,25.27) v1(47.75,23.5) v1(47.75,21.08) 47.75,20.95 v1(46.23,19.43) v1(44.7,17.91) v1(43.43,16.64) 41.78,14.99 v1(41.66,14.99) v1(39.12,14.99) v1(37.59,16.51) v1(37.59,18.56) v1(37.59,20.19) C12.2 ; SW4.4 v1(31.24,7.81) ; C1.1 43.43,49.47 C2.1 41.46,49.4 38.78,49.4 ; 30.12,35.2 v1(27.18,32.27) 27.18,32.26 ; SW4.3 v1(38.48,7.81) ; C15.1 v1(24.27,17.78) ; SW1.1 7.75,55.25 v1(7.75,57.28) ; SW6.1 v1(8,7.81) 8,5.21 7.49,4.7 H2.2 ; v1(25.53,30.61) 24.11,32.02 24.11,32.02 ; v1(29.34,29.59) 30.23,28.7 31.67,28.7 U1.8 ; v1(28.56,29.08) 27.94,28.46 27.94,26.66 27.29,26.01 ; C4.1 36.89,39.5 v1(38.73,39.5) v1(38.73,40.77) ; 38.78,49.4 v1(38.73,49.36) v1(38.73,47.24) v1(38.73,45.91) v1(38.73,44.2) v1(38.73,42.8) v1(38.73,40.77) ; 38.78,49.4 36.07,49.4 35.64,48.97 U14.1 ; C3.1 v1(38.73,40.77) ; SW3.3 v1(50.04,7.81) ; USB2.1 51.25,56.85 USB2.13 ; USB2.12 43.75,56.85 USB2.14 ; 43.05,7.75 v1(43.11,7.81) SW3.4 ; SW6.2 v1(14.73,7.81) ; 32.02,21.86 v1(33.22,20.65) v1(33.93,19.94) v1(35.05,19.94) v1(37.21,22.1) v1(37.21,23.24) v1(36.41,24.04) 35.45,25.01 C11.2 ; SW5.2 v1(26.8,7.81) ; SW5.1 v1(19.56,7.81)
  Bottom Layer w0.254: v1(27.18,32.27) 27.8,32.89 27.8,32.91 ; USB2.13 USB2.13 54.02,56.85 54.61,56.26 H3.20 H3.19 ; 27.78,28.3 v1(28.56,29.08) 28.58,29.08 ; 23.64,17.14 23.64,13.47 22.73,12.57 8.89,12.57 8,11.68 v1(8,7.81) ; 23.64,17.14 BT1.2 ; 23.64,17.14 v1(24.27,17.78) ; R3.2 v1(2.03,61.6) ; C7.1 v1(13.59,57.53) ; v1(25.53,30.61) 25.45,30.53 R6.2 ; R14.2 28.32,31 v1(28.32,30.99) ; C9.2 29.46,29.72 ; USB2.14 USB2.14
  Bottom Layer w0.508: P1.6 P1.5
  vias: v1(2.59,58.5) v1(2.59,55.96) v1(2.59,53.42) v1(7.67,12.78) v1(7.67,10.24) v1(7.67,5.16) v1(7.67,2.62) v1(12.75,50.88) v1(12.75,30.56) v1(12.75,12.78) v1(12.75,2.62) v1(17.83,61.04) v1(17.83,55.96) v1(17.83,43.26) v1(17.83,40.72) v1(17.83,30.56) v1(17.83,22.94) v1(17.83,17.86) v1(17.83,12.78) v1(17.83,10.24) v1(17.83,7.7) v1(17.83,5.16) v1(17.83,2.62) v1(22.91,61.04) v1(22.91,55.96) v1(22.91,48.34) v1(22.91,45.8) v1(22.91,40.72) v1(22.91,30.56) v1(22.91,15.32) v1(22.91,12.78) v1(22.91,10.24) v1(22.91,2.62) v1(27.5,47.24) v1(27.99,61.04) v1(27.99,55.96) v1(27.99,50.88) v1(27.99,48.34) v1(27.99,45.8) v1(27.99,40.72) v1(29.01,47.24) v1(30.25,47.24) v1(31.47,47.24) v1(32.65,47.24) v1(33.07,61.04) v1(33.07,55.96) v1(33.07,50.88) v1(33.07,48.34) v1(33.07,45.8) v1(33.07,40.72) v1(33.07,15.32) v1(33.07,12.78) v1(33.07,10.24) v1(38.15,61.04) v1(38.15,58.5) v1(38.15,55.96) v1(38.15,53.42) v1(38.15,50.88) v1(38.15,48.34) v1(38.15,43.26) v1(38.15,28.02) v1(38.15,22.94) v1(38.15,17.86) v1(38.15,15.32) v1(43.23,58.5) v1(43.23,53.42) v1(43.23,50.88) v1(43.23,40.72) v1(43.23,28.02) v1(43.23,22.94) v1(43.23,20.4) v1(43.23,17.86) v1(43.23,15.32) v1(44.83,62.1) v1(44.83,61.09) v1(46.61,62.1) v1(46.61,61.09) v1(48.31,58.5) v1(48.31,50.88) v1(48.31,43.26) v1(48.31,25.48) v1(48.31,22.94) v1(48.31,20.4) v1(48.31,17.86) v1(48.51,62.1) v1(48.51,61.09) v1(50.29,62.1) v1(50.29,61.03) v1(53.39,61.04) v1(53.39,55.96) v1(53.39,53.42)
VBAT: length 57.1
  Top Layer w0.254: D1.3 25.11,21.2 C15.2 27.8,21.2 27.92,21.31 27.92,22.39 ; 27.92,22.39 30.2,24.67 30.2,25.22 U1.1 ; 27.92,22.39 27.94,22.37 27.94,3.56 29.46,2.03 H3.1
VIN: length 41.9
  Top Layer w0.508: v1(40.26,55.25) v1(45.08,55.25) 45.1,55.26 USB2.11 45.08,56.29 ; v1(49.91,55.25) 49.9,55.26 USB2.2 ; F1.2 v1(20.7,57.02)
  Bottom Layer w0.508: v1(20.7,57.02) 20.7,59.05 21.46,59.82 P1.9 23.88,60.96 24.89,61.98 39.24,61.98 40.26,60.96 v1(40.26,55.25)
BOOT0: length 46.4
  Top Layer w0.254: v1(48.64,40.13) SW14.2 ; 26.54,29.46 26.92,29.08 26.92,27.77 U1.44
  Bottom Layer w0.254: v1(48.64,40.13) 23.37,40.13 21.84,38.61 21.84,29.46 23.11,28.19 25.23,28.19 R6.1
  vias: v1(26.53,29.43)
BOOT1: length 27
  Top Layer w0.254: v1(47.37,37.59) SW14.1 ; 29.97,33.02 v1(30.05,33.02) U1.20
  Bottom Layer w0.254: R14.1 30.09,36.57 31.11,37.59 v1(47.37,37.59)
KEY1: length 54.3
  Top Layer w0.254: U1.10 33.84,27.94 35.31,27.94 38.1,30.73 46.61,30.73 50.29,27.05 50.29,16.51 H3.5 ; SW3.2 46.51,5.66 ; 46.51,5.66 SW3.1 ; 46.51,5.66 v1(46.51,9.4)
  Bottom Layer w0.254: v1(46.51,9.4) 49.3,12.19 H3.5
KEY2: length 64.4
  Top Layer w0.254: 33.53,28.96 34.04,28.45 35.05,28.45 37.85,31.24 46.86,31.24 50.8,27.31 50.8,18.54 H3.6 ; v1(34.92,9.4) 34.92,5.69 34.89,5.66 ; 34.89,5.66 SW4.2 ; 34.89,5.66 SW4.1
  Bottom Layer w0.254: H3.6 54.48,14.61 49.28,14.61 44.96,10.29 35.81,10.29 v1(34.92,9.4)
KEY3: length 82.6
  Top Layer w0.254: 23.03,5.66 v1(23.03,9.14) ; 23.03,5.66 SW5.3 ; 23.03,5.66 SW5.4 ; U1.18 33.25,34.8 52.32,34.8 H3.13
  Bottom Layer w0.254: v1(23.03,9.14) 25.06,11.18 44.7,11.18 49.15,15.62 51.82,15.62 52.45,16.26 52.45,32.13 52.83,32.51 H3.13
KEY4: length 95.7
  Top Layer w0.254: SW6.3 11.51,5.66 ; 11.51,5.66 v1(11.51,9.14) ; 11.51,5.66 SW6.4 ; 54.74,35.05 54.48,35.31 33.05,35.31 U1.19
  Bottom Layer w0.254: H3.14 54.36,35.31 53.21,35.31 51.94,34.04 51.94,17.14 51.18,16.38 48.89,16.38 44.32,11.81 14.18,11.81 v1(11.51,9.14)
NRST: length 110.8
  Top Layer w0.254: U1.7 32.48,27.18 v1(33.27,27.18) ; 11.81,55.25 11.81,54.11 11.43,53.72 v1(6.1,53.72) ; H3.17 56.26,44.32 56.26,56.64 53.09,59.82 34.04,59.82 32.77,58.55 12.83,58.55 11.96,57.68 v1(11.96,54.99)
  Bottom Layer w0.254: C7.2 13.52,54.99 v1(11.96,54.99) ; R5.1 6.1,54.98 v1(6.1,53.72) ; v1(33.27,27.18) 50.17,27.18 51.31,28.32 51.31,41.28 52.7,42.67 H3.17
OSCIN: length 15.5
  Top Layer w0.254: U1.5 32.34,25.91 36.7,25.91 39.48,23.13 C12.1 41.07,20.5 Y2.2
OSCOUT: length 15.4
  Top Layer w0.254: 31.53,27.42 32.41,26.54 36.83,26.54 39.86,23.51 C13.1 42.88,21.66 Y2.1
PA2: length 32.4
  Top Layer w0.254: U1.12 34.24,28.96 34.92,28.96 37.72,31.75 47.12,31.75 51.31,27.56 51.31,20.57 H3.7
PA3: length 29.4
  Top Layer w0.254: H3.8 54.61,20.45 51.82,23.24 51.82,27.81 47.37,32.26 34.24,32.26 U1.13
PA4: length 28
  Top Layer w0.254: 33.3,32.02 33.3,32.03 34.04,32.77 47.75,32.77 52.45,28.07 52.45,24.51 H3.9
PA5: length 26.6
  Top Layer w0.254: H3.10 53.09,26.42 53.09,28.19 48.01,33.27 33.84,33.27 U1.15
PA6: length 25.1
  Top Layer w0.254: U1.16 33.64,33.78 48.26,33.78 H3.11
PA7: length 24.7
  Top Layer w0.254: H3.12 50.29,34.29 33.45,34.29 U1.17
PA8: length 26.2
  Top Layer w0.254: U1.29 24.43,35.94 6.86,35.94 H2.16
PA9: length 60.9
  Top Layer w0.254: v1(4.57,49.4) 4.62,49.45 24.81,49.45 R13.2 ; U1.30 24.23,35.43 4.83,35.43 H2.15
  Bottom Layer w0.254: H2.15 4.06,37.72 4.57,38.23 v1(4.57,49.4)
PA10: length 60
  Top Layer w0.254: 25.52,33.44 24.03,34.92 2.79,34.92 H2.14 ; R10.1 22.88,50.04 v1(5.33,50.04)
  Bottom Layer w0.254: H2.14 4.7,35.18 5.33,35.81 v1(5.33,50.04)
PA11: length 69.5
  Top Layer w0.254: R11.1 50.29,53.59 v1(50.29,38.23) ; H2.13 4.19,34.29 v1(23.62,34.29) 23.96,34.29 U1.32
  Bottom Layer w0.254: v1(50.29,38.23) 25.02,38.23 23.62,36.83 v1(23.62,34.29)
PA12: length 74.3
  Top Layer w0.254: R12.1 45.22,52.19 45.72,51.69 49.15,51.69 49.53,51.31 v1(49.53,38.86) ; H2.12 6.1,33.66 v1(22.73,33.66) 23.89,33.66 U1.33
  Bottom Layer w0.254: v1(22.73,33.66) 22.73,37.59 24,38.86 v1(49.53,38.86)
PA15: length 22.2
  Top Layer w0.254: 24.11,29.19 22.47,27.56 H2.11
PB3: length 23.5
  Top Layer w0.254: H2.10 4.57,27.05 22.67,27.05 U1.39
PB4: length 24.8
  Top Layer w0.254: H2.9 6.6,26.54 22.87,26.54 U1.40
PB5: length 26
  Top Layer w0.254: U1.41 23.07,26.03 8.64,26.03 H2.8
PB6: length 27.3
  Top Layer w0.254: 25.52,27.78 23.27,25.53 10.67,25.53 H2.7
PB7: length 28.5
  Top Layer w0.254: H2.6 12.7,25.02 23.47,25.02 25.87,27.42
PB8: length 30
  Top Layer w0.254: H2.5 14.73,24.51 24.37,24.51 U1.45
PB9: length 31.3
  Top Layer w0.254: H2.4 16.76,24 24.57,24 U1.46
PB10: length 25.1
  Top Layer w0.254: U1.21 32.14,35.81 52.96,35.81 54.61,37.47 H3.15
PB11: length 26.5
  Top Layer w0.254: 54.74,40.13 50.93,36.32 31.94,36.32 U1.22
PB12: length 31.3
  Top Layer w0.254: U1.25 25.1,38.1 14.86,38.1 H2.20
PB13: length 30
  Top Layer w0.254: H2.19 12.83,37.59 24.9,37.59 U1.26
PB14: length 28.7
  Top Layer w0.254: U1.27 24.7,37.08 10.8,37.08 H2.18
PB15: length 27.5
  Top Layer w0.254: H2.17 8.76,36.58 24.5,36.58 U1.28
PC13: length 101.1
  Top Layer w0.254: H3.2 47.12,12.06 37.46,12.06 29.72,19.81 v1(29.72,20.95) 29.72,23.37 30.86,24.51 30.86,25.27 30.12,26.01
  Bottom Layer w0.254: 29.72,20.95 11.94,20.95 7.49,25.4 7.49,52.7 9.78,54.99 9.78,61.21 9.27,61.72 7.94,61.72
PC14: length 41.9
  Top Layer w0.254: U1.3 31.91,24.92 ; 31.91,24.92 30.35,23.37 30.35,19.94 37.59,12.7 49.02,12.7 H3.3 ; 31.91,24.92 33.01,23.83 33.01,22.85 33.23,22.85 34.58,21.5
PC15: length 41.6
  Top Layer w0.254: v1(33.27,25.27) 32.8,24.8 32.73,24.8 ; 32.73,24.8 30.82,26.71 U1.4 ; 32.73,24.8 33.52,24.02 C11.1 34.46,24.02 35.78,22.7 ; v1(31.88,23.88) 30.86,22.86 30.86,20.19 37.59,13.46 50.8,13.46 H3.4
  Bottom Layer w0.254: v1(33.27,25.27) v1(31.88,23.88)
SWCLK: length 64.3
  Top Layer w0.254: U1.37 22.91,28.7 v1(10.03,28.7)
  Bottom Layer w0.254: v1(10.03,28.7) 10.03,50.8 12.19,52.96 32.26,52.96 34.04,54.74 34.04,57.28
SWDIO: length 61.1
  Top Layer w0.254: v1(8.76,33.02) 23.81,33.02 U1.34
  Bottom Layer w0.254: v1(8.76,33.02) 8.76,51.69 10.92,53.85 30.48,53.85 31.5,54.86 P1.4
$1N1572: length 1.3
  Top Layer w0.254: v1(3.56,59.44) 3.57,59.45 LED1.1
  Bottom Layer w0.254: R3.1 v1(3.56,59.44)
$1N1573: length 1.6
  Top Layer w0.254: v1(12.19,59.31) 12.2,59.32 LED3.1
  Bottom Layer w0.254: 12.16,60.12 12.19,60.08 v1(12.19,59.31)
$1N1999: length 1.7
  Top Layer w0.254: LED2.1 v1(8.01,59.31)
  Bottom Layer w0.254: R9.1 8.01,60.14 v1(8.01,59.31)
$1N2194: length 16.8
  Top Layer w0.254: D1.2 21.04,19.43 v1(14.99,19.43)
  Bottom Layer w0.254: BT1.1 8,17.15 8,18.8 8.64,19.43 v1(14.99,19.43)
$1N2577: length 4.2
  Top Layer w0.254: R11.2 48.25,54.12 48.25,55.22 ; 48.25,55.22 USB2.5 ; 48.25,55.22 47.65,55.22 47.25,55.62 USB2.7
$1N2578: length 5.3
  Top Layer w0.254: USB2.6 47.75,57.15 47.5,57.4 46.99,57.4 46.75,57.16 USB2.8 46.73,56.28 R12.2
$1N2967: length 7.8
  Top Layer w0.508: v1(18.29,51.56) F1.1
  Bottom Layer w0.508: v1(18.29,51.56) 17.4,51.56 16.89,51.05 16.89,48.22 17.4,47.71 U7.4
$1N3147: length 4.7
  Top Layer w0.254: R13.1 26.42,52.59 26.42,57.28
$1N3155: length 4.7
  Top Layer w0.254: R10.2 23.88,52.64 P1.10

## Copper pours and planes (outline as drawn; the poured copper is in the pictures)
3V3 on Top Layer: 40.51,48.51 44.14,48.51 44.14,43.18 40.51,43.18
+5V on Top Layer: 24.89,43.81 36.98,43.81 36.98,40.51 24.89,40.51
+5V on Top Layer: 34.16,43.31 37.08,43.31 37.08,38.35 34.16,38.35
GND on Top Layer: 24.92,48.89 37.08,48.89 37.08,45.59 24.92,45.59
GND on Top Layer: -6.1,68.83 62.99,68.83 62.99,-3.3 -6.1,-3.3
GND on Bottom Layer: -2.67,66.8 62.36,66.8 62.36,0.38 -2.67,0.38
VIN on Bottom Layer: 44.7,55.63 50.29,55.63 50.29,54.86 44.7,54.86

Small or netless copper shapes (teardrops, artwork), in the pictures only: 290 on Top Layer, 94 on Bottom Layer
